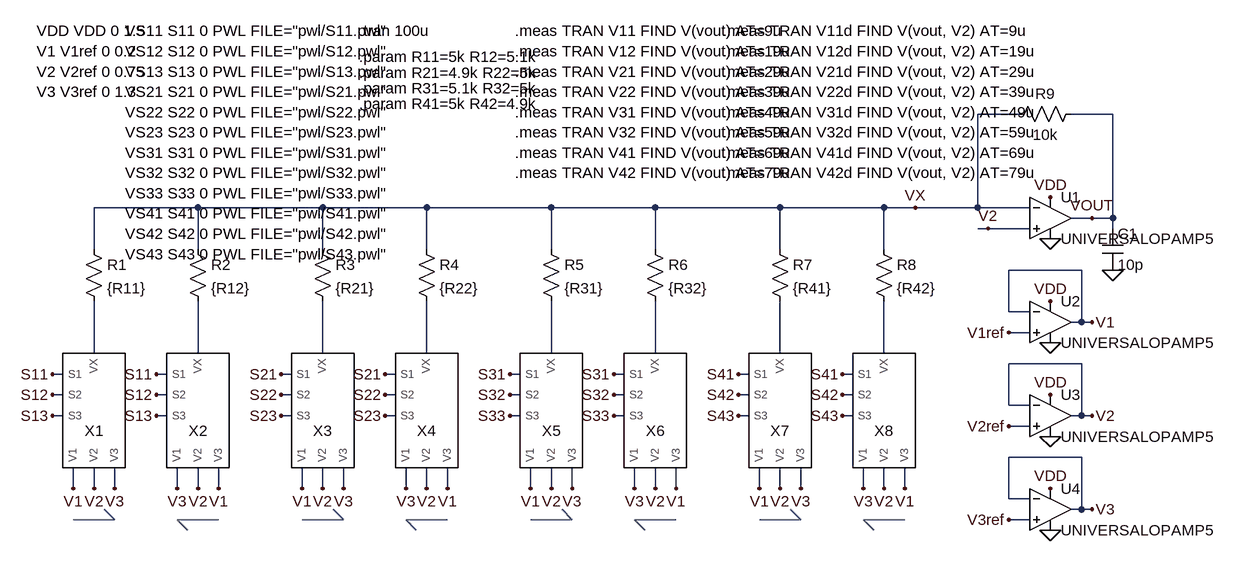
[diagram p0: schematic RSW_tb.asc]
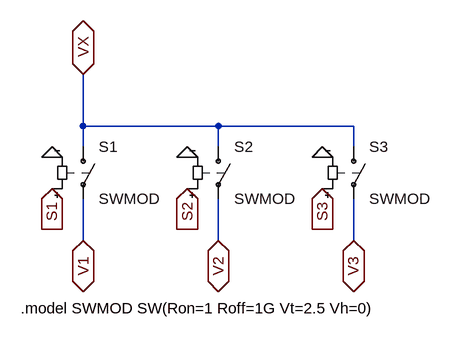
[diagram p1: sub-circuit sw3.asc]
RSW_tb.asc, the LTspice schematic file:
Version 4
SHEET 1 1884 904
WIRE 1600 -144 1536 -144
WIRE 1744 -144 1680 -144
WIRE 336 0 176 0
WIRE 528 0 336 0
WIRE 688 0 528 0
WIRE 880 0 688 0
WIRE 1040 0 880 0
WIRE 1232 0 1040 0
WIRE 1392 0 1232 0
WIRE 1440 0 1392 0
WIRE 1536 0 1536 -144
WIRE 1536 0 1440 0
WIRE 1616 0 1536 0
WIRE 1648 0 1648 -16
WIRE 1712 16 1680 16
WIRE 1744 16 1744 -144
WIRE 1744 16 1712 16
WIRE 1552 32 1536 32
WIRE 1616 32 1552 32
WIRE 1744 32 1744 16
WIRE 176 64 176 0
WIRE 336 64 336 0
WIRE 528 64 528 0
WIRE 688 64 688 0
WIRE 880 64 880 0
WIRE 1040 64 1040 0
WIRE 1232 64 1232 0
WIRE 1392 64 1392 0
WIRE 1696 96 1584 96
WIRE 1584 160 1584 96
WIRE 1616 160 1584 160
WIRE 1648 160 1648 144
WIRE 1696 176 1696 96
WIRE 1696 176 1680 176
WIRE 1712 176 1696 176
WIRE 1616 192 1584 192
WIRE 176 224 176 144
WIRE 336 224 336 144
WIRE 528 224 528 144
WIRE 688 224 688 144
WIRE 880 224 880 144
WIRE 1040 224 1040 144
WIRE 1232 224 1232 144
WIRE 1392 224 1392 144
WIRE 1696 240 1584 240
WIRE 128 256 112 256
WIRE 288 256 272 256
WIRE 480 256 464 256
WIRE 640 256 624 256
WIRE 832 256 816 256
WIRE 992 256 976 256
WIRE 1184 256 1168 256
WIRE 1344 256 1328 256
WIRE 128 288 112 288
WIRE 288 288 272 288
WIRE 480 288 464 288
WIRE 640 288 624 288
WIRE 832 288 816 288
WIRE 992 288 976 288
WIRE 1184 288 1168 288
WIRE 1344 288 1328 288
WIRE 1584 304 1584 240
WIRE 1616 304 1584 304
WIRE 1648 304 1648 288
WIRE 128 320 112 320
WIRE 288 320 272 320
WIRE 480 320 464 320
WIRE 640 320 624 320
WIRE 832 320 816 320
WIRE 992 320 976 320
WIRE 1184 320 1168 320
WIRE 1344 320 1328 320
WIRE 1696 320 1696 240
WIRE 1696 320 1680 320
WIRE 1712 320 1696 320
WIRE 1616 336 1584 336
WIRE 1696 384 1584 384
WIRE 144 432 144 400
WIRE 176 432 176 400
WIRE 208 432 208 400
WIRE 304 432 304 400
WIRE 336 432 336 400
WIRE 368 432 368 400
WIRE 496 432 496 400
WIRE 528 432 528 400
WIRE 560 432 560 400
WIRE 656 432 656 400
WIRE 688 432 688 400
WIRE 720 432 720 400
WIRE 848 432 848 400
WIRE 880 432 880 400
WIRE 912 432 912 400
WIRE 1008 432 1008 400
WIRE 1040 432 1040 400
WIRE 1072 432 1072 400
WIRE 1200 432 1200 400
WIRE 1232 432 1232 400
WIRE 1264 432 1264 400
WIRE 1360 432 1360 400
WIRE 1392 432 1392 400
WIRE 1424 432 1424 400
WIRE 1584 448 1584 384
WIRE 1616 448 1584 448
WIRE 1648 448 1648 432
WIRE 1696 464 1696 384
WIRE 1696 464 1680 464
WIRE 1712 464 1696 464
WIRE 1616 480 1584 480
FLAG 144 432 V1
FLAG 176 432 V2
FLAG 208 432 V3
FLAG 112 256 S11
FLAG 112 288 S12
FLAG 112 320 S13
FLAG 304 432 V3
FLAG 336 432 V2
FLAG 368 432 V1
FLAG 272 256 S11
FLAG 272 288 S12
FLAG 272 320 S13
FLAG 496 432 V1
FLAG 528 432 V2
FLAG 560 432 V3
FLAG 464 256 S21
FLAG 464 288 S22
FLAG 464 320 S23
FLAG 656 432 V3
FLAG 688 432 V2
FLAG 720 432 V1
FLAG 624 256 S21
FLAG 624 288 S22
FLAG 624 320 S23
FLAG 848 432 V1
FLAG 880 432 V2
FLAG 912 432 V3
FLAG 816 256 S31
FLAG 816 288 S32
FLAG 816 320 S33
FLAG 1008 432 V3
FLAG 1040 432 V2
FLAG 1072 432 V1
FLAG 976 256 S31
FLAG 976 288 S32
FLAG 976 320 S33
FLAG 1200 432 V1
FLAG 1232 432 V2
FLAG 1264 432 V3
FLAG 1168 256 S41
FLAG 1168 288 S42
FLAG 1168 320 S43
FLAG 1360 432 V3
FLAG 1392 432 V2
FLAG 1424 432 V1
FLAG 1440 0 VX
FLAG 1328 256 S41
FLAG 1328 288 S42
FLAG 1328 320 S43
FLAG 1552 32 V2
FLAG 1648 48 0
FLAG 1648 -16 VDD
FLAG 1744 96 0
FLAG 1712 16 VOUT
FLAG 1648 208 0
FLAG 1648 144 VDD
FLAG 1712 176 V1
FLAG 1584 192 V1ref
FLAG 1648 352 0
FLAG 1648 288 VDD
FLAG 1712 320 V2
FLAG 1584 336 V2ref
FLAG 1648 496 0
FLAG 1648 432 VDD
FLAG 1712 464 V3
FLAG 1584 480 V3ref
SYMBOL SW3 176 304 R0
SYMATTR InstName X1
SYMBOL res 160 48 R0
SYMATTR InstName R1
SYMATTR Value {R11}
SYMBOL SW3 336 304 R0
SYMATTR InstName X2
SYMBOL res 320 48 R0
SYMATTR InstName R2
SYMATTR Value {R12}
SYMBOL SW3 528 304 R0
SYMATTR InstName X3
SYMBOL res 512 48 R0
SYMATTR InstName R3
SYMATTR Value {R21}
SYMBOL SW3 688 304 R0
SYMATTR InstName X4
SYMBOL res 672 48 R0
SYMATTR InstName R4
SYMATTR Value {R22}
SYMBOL SW3 880 304 R0
SYMATTR InstName X5
SYMBOL res 864 48 R0
SYMATTR InstName R5
SYMATTR Value {R31}
SYMBOL SW3 1040 304 R0
SYMATTR InstName X6
SYMBOL res 1024 48 R0
SYMATTR InstName R6
SYMATTR Value {R32}
SYMBOL SW3 1232 304 R0
SYMATTR InstName X7
SYMBOL res 1216 48 R0
SYMATTR InstName R7
SYMATTR Value {R41}
SYMBOL SW3 1392 304 R0
SYMATTR InstName X8
SYMBOL res 1376 48 R0
SYMATTR InstName R8
SYMATTR Value {R42}
SYMBOL cap 1728 32 R0
SYMATTR InstName C1
SYMATTR Value 10p
SYMBOL res 1696 -160 R90
WINDOW 0 0 56 VBottom 2
WINDOW 3 32 56 VTop 2
SYMATTR InstName R9
SYMATTR Value 10k
SYMBOL OpAmps\\UniversalOpAmp5 1648 16 R0
SYMATTR InstName U1
SYMBOL OpAmps\\UniversalOpAmp5 1648 176 R0
SYMATTR InstName U2
SYMBOL OpAmps\\UniversalOpAmp5 1648 320 R0
SYMATTR InstName U3
SYMBOL OpAmps\\UniversalOpAmp5 1648 464 R0
SYMATTR InstName U4
TEXT 584 -272 Left 2 !.tran 100u
TEXT 224 -272 Left 2 !VS11 S11 0 PWL FILE="pwl/S11.pwl"\nVS12 S12 0 PWL FILE="pwl/S12.pwl"\nVS13 S13 0 PWL FILE="pwl/S13.pwl"\nVS21 S21 0 PWL FILE="pwl/S21.pwl"\nVS22 S22 0 PWL FILE="pwl/S22.pwl"\nVS23 S23 0 PWL FILE="pwl/S23.pwl"\nVS31 S31 0 PWL FILE="pwl/S31.pwl"\nVS32 S32 0 PWL FILE="pwl/S32.pwl"\nVS33 S33 0 PWL FILE="pwl/S33.pwl"\nVS41 S41 0 PWL FILE="pwl/S41.pwl"\nVS42 S42 0 PWL FILE="pwl/S42.pwl"\nVS43 S43 0 PWL FILE="pwl/S43.pwl"
TEXT 88 -272 Left 2 !VDD VDD 0 1.5\nV1 V1ref 0 0.2\nV2 V2ref 0 0.75\nV3 V3ref 0 1.3
TEXT 584 -232 Left 2 !.param R11=5k R12=5.1k
TEXT 584 -208 Left 2 !.param R21=4.9k R22=5k
TEXT 584 -184 Left 2 !.param R31=5.1k R32=5k
TEXT 584 -160 Left 2 !.param R41=5k R42=4.9k
TEXT 824 -272 Left 2 !.meas TRAN V11 FIND V(vout) AT=9u\n.meas TRAN V12 FIND V(vout) AT=19u\n.meas TRAN V21 FIND V(vout) AT=29u\n.meas TRAN V22 FIND V(vout) AT=39u\n.meas TRAN V31 FIND V(vout) AT=49u\n.meas TRAN V32 FIND V(vout) AT=59u\n.meas TRAN V41 FIND V(vout) AT=69u\n.meas TRAN V42 FIND V(vout) AT=79u
TEXT 1144 -272 Left 2 !.meas TRAN V11d FIND V(vout, V2) AT=9u\n.meas TRAN V12d FIND V(vout, V2) AT=19u\n.meas TRAN V21d FIND V(vout, V2) AT=29u\n.meas TRAN V22d FIND V(vout, V2) AT=39u\n.meas TRAN V31d FIND V(vout, V2) AT=49u\n.meas TRAN V32d FIND V(vout, V2) AT=59u\n.meas TRAN V41d FIND V(vout, V2) AT=69u\n.meas TRAN V42d FIND V(vout, V2) AT=79u
LINE Normal 192 480 192 480 2
LINE Normal 208 480 144 480
LINE Normal 192 464 208 480
LINE Normal 192 464 192 464
LINE Normal 320 480 320 480 2
LINE Normal 304 480 368 480
LINE Normal 320 496 304 480
LINE Normal 320 496 320 496
LINE Normal 544 480 544 480 2
LINE Normal 560 480 496 480
LINE Normal 544 464 560 480
LINE Normal 544 464 544 464
LINE Normal 672 480 672 480 2
LINE Normal 656 480 720 480
LINE Normal 672 496 656 480
LINE Normal 672 496 672 496
LINE Normal 896 480 896 480 2
LINE Normal 912 480 848 480
LINE Normal 896 464 912 480
LINE Normal 896 464 896 464
LINE Normal 1024 480 1024 480 2
LINE Normal 1008 480 1072 480
LINE Normal 1024 496 1008 480
LINE Normal 1024 496 1024 496
LINE Normal 1248 480 1248 480 2
LINE Normal 1264 480 1200 480
LINE Normal 1248 464 1264 480
LINE Normal 1248 464 1248 464
LINE Normal 1376 480 1376 480 2
LINE Normal 1360 480 1424 480
LINE Normal 1376 496 1360 480
LINE Normal 1376 496 1376 496

sw3.asc, the sub-circuit schematic file:
Version 4.1
SHEET 1 880 680
WIRE 128 96 128 16
WIRE 336 96 128 96
WIRE 544 96 336 96
WIRE 128 128 128 96
WIRE 336 128 336 96
WIRE 544 128 544 96
WIRE 128 272 128 208
WIRE 336 272 336 208
WIRE 544 272 544 208
FLAG 80 144 0
FLAG 288 144 0
FLAG 496 144 0
FLAG 80 192 S1
IOPIN 80 192 In
FLAG 288 192 S2
IOPIN 288 192 In
FLAG 496 192 S3
IOPIN 496 192 In
FLAG 128 272 V1
IOPIN 128 272 BiDir
FLAG 336 272 V2
IOPIN 336 272 BiDir
FLAG 544 272 V3
IOPIN 544 272 BiDir
FLAG 128 16 VX
IOPIN 128 16 BiDir
SYMBOL sw 128 112 R0
SYMATTR InstName S1
SYMATTR Value SWMOD
SYMBOL sw 336 112 R0
SYMATTR InstName S2
SYMATTR Value SWMOD
SYMBOL sw 544 112 R0
SYMATTR InstName S3
SYMATTR Value SWMOD
TEXT 32 376 Left 2 !.model SWMOD SW(Ron=1 Roff=1G Vt=2.5 Vh=0)

The netlist it stands for:
* RSW_tb.asc
XX1 S11 S12 S13 V1 V2 V3 N001 sw3
R1 VX N001 {R11}
XX2 S11 S12 S13 V3 V2 V1 N002 sw3
R2 VX N002 {R12}
XX3 S21 S22 S23 V1 V2 V3 N003 sw3
R3 VX N003 {R21}
XX4 S21 S22 S23 V3 V2 V1 N004 sw3
R4 VX N004 {R22}
XX5 S31 S32 S33 V1 V2 V3 N005 sw3
R5 VX N005 {R31}
XX6 S31 S32 S33 V3 V2 V1 N006 sw3
R6 VX N006 {R32}
XX7 S41 S42 S43 V1 V2 V3 N007 sw3
R7 VX N007 {R41}
XX8 S41 S42 S43 V3 V2 V1 N008 sw3
R8 VX N008 {R42}
C1 VOUT 0 10p
R9 VOUT VX 10k
XU1 V2 VX VDD 0 VOUT level5 Avol=1Meg GBW=10Meg Phimargin=45 SlewPos=10Meg SlewNeg=10Meg En=0 Enk=0 In=0 Ink=0 Rcm=500Meg Ccm=1p Rdiff=500k Cdiff=2p Ro=1k Vos=0 Ibp=2n Ibn=1n Iq=1m Rail=0 Ilimit=25m  ; UNIVERSALOPAMP5, pins In+ In- V+ V- OUT
XU2 V1ref V1 VDD 0 V1 level5 Avol=1Meg GBW=10Meg Phimargin=45 SlewPos=10Meg SlewNeg=10Meg En=0 Enk=0 In=0 Ink=0 Rcm=500Meg Ccm=1p Rdiff=500k Cdiff=2p Ro=1k Vos=0 Ibp=2n Ibn=1n Iq=1m Rail=0 Ilimit=25m  ; UNIVERSALOPAMP5, pins In+ In- V+ V- OUT
XU3 V2ref V2 VDD 0 V2 level5 Avol=1Meg GBW=10Meg Phimargin=45 SlewPos=10Meg SlewNeg=10Meg En=0 Enk=0 In=0 Ink=0 Rcm=500Meg Ccm=1p Rdiff=500k Cdiff=2p Ro=1k Vos=0 Ibp=2n Ibn=1n Iq=1m Rail=0 Ilimit=25m  ; UNIVERSALOPAMP5, pins In+ In- V+ V- OUT
XU4 V3ref V3 VDD 0 V3 level5 Avol=1Meg GBW=10Meg Phimargin=45 SlewPos=10Meg SlewNeg=10Meg En=0 Enk=0 In=0 Ink=0 Rcm=500Meg Ccm=1p Rdiff=500k Cdiff=2p Ro=1k Vos=0 Ibp=2n Ibn=1n Iq=1m Rail=0 Ilimit=25m  ; UNIVERSALOPAMP5, pins In+ In- V+ V- OUT

* block symbol definitions
.subckt sw3 S1 S2 S3 V1 V2 V3 VX
S1 VX V1 S1 0 SWMOD
S2 VX V2 S2 0 SWMOD
S3 VX V3 S3 0 SWMOD
.model SWMOD SW(Ron=1 Roff=1G Vt=2.5 Vh=0)
.ends sw3

.tran 100u
VS11 S11 0 PWL FILE="pwl/S11.pwl"
VS12 S12 0 PWL FILE="pwl/S12.pwl"
VS13 S13 0 PWL FILE="pwl/S13.pwl"
VS21 S21 0 PWL FILE="pwl/S21.pwl"
VS22 S22 0 PWL FILE="pwl/S22.pwl"
VS23 S23 0 PWL FILE="pwl/S23.pwl"
VS31 S31 0 PWL FILE="pwl/S31.pwl"
VS32 S32 0 PWL FILE="pwl/S32.pwl"
VS33 S33 0 PWL FILE="pwl/S33.pwl"
VS41 S41 0 PWL FILE="pwl/S41.pwl"
VS42 S42 0 PWL FILE="pwl/S42.pwl"
VS43 S43 0 PWL FILE="pwl/S43.pwl"
VDD VDD 0 1.5
V1 V1ref 0 0.2
V2 V2ref 0 0.75
V3 V3ref 0 1.3
.param R11=5k R12=5.1k
.param R21=4.9k R22=5k
.param R31=5.1k R32=5k
.param R41=5k R42=4.9k
.meas TRAN V11 FIND V(vout) AT=9u
.meas TRAN V12 FIND V(vout) AT=19u
.meas TRAN V21 FIND V(vout) AT=29u
.meas TRAN V22 FIND V(vout) AT=39u
.meas TRAN V31 FIND V(vout) AT=49u
.meas TRAN V32 FIND V(vout) AT=59u
.meas TRAN V41 FIND V(vout) AT=69u
.meas TRAN V42 FIND V(vout) AT=79u
.meas TRAN V11d FIND V(vout, V2) AT=9u
.meas TRAN V12d FIND V(vout, V2) AT=19u
.meas TRAN V21d FIND V(vout, V2) AT=29u
.meas TRAN V22d FIND V(vout, V2) AT=39u
.meas TRAN V31d FIND V(vout, V2) AT=49u
.meas TRAN V32d FIND V(vout, V2) AT=59u
.meas TRAN V41d FIND V(vout, V2) AT=69u
.meas TRAN V42d FIND V(vout, V2) AT=79u
.backanno
.end